# EasyEDA Pro project 辅助电源.epro, schematic 平面变压器_氮化镓电源
Board Name: 平面变压器_氮化镓电源; Create Date: 2025-12-22; Page Name: Sheet_1; Project Name: 辅助电源; Schematic Name: 平面变压器_氮化镓电源; Update Date: 2025-12-25; Add into BOM: yes; Company: Your Company; Convert to PCB: yes; Date: 2023-12-31; Draw By: adminismk; REV: 1.0; Sheet: 1/1; spicePre: .
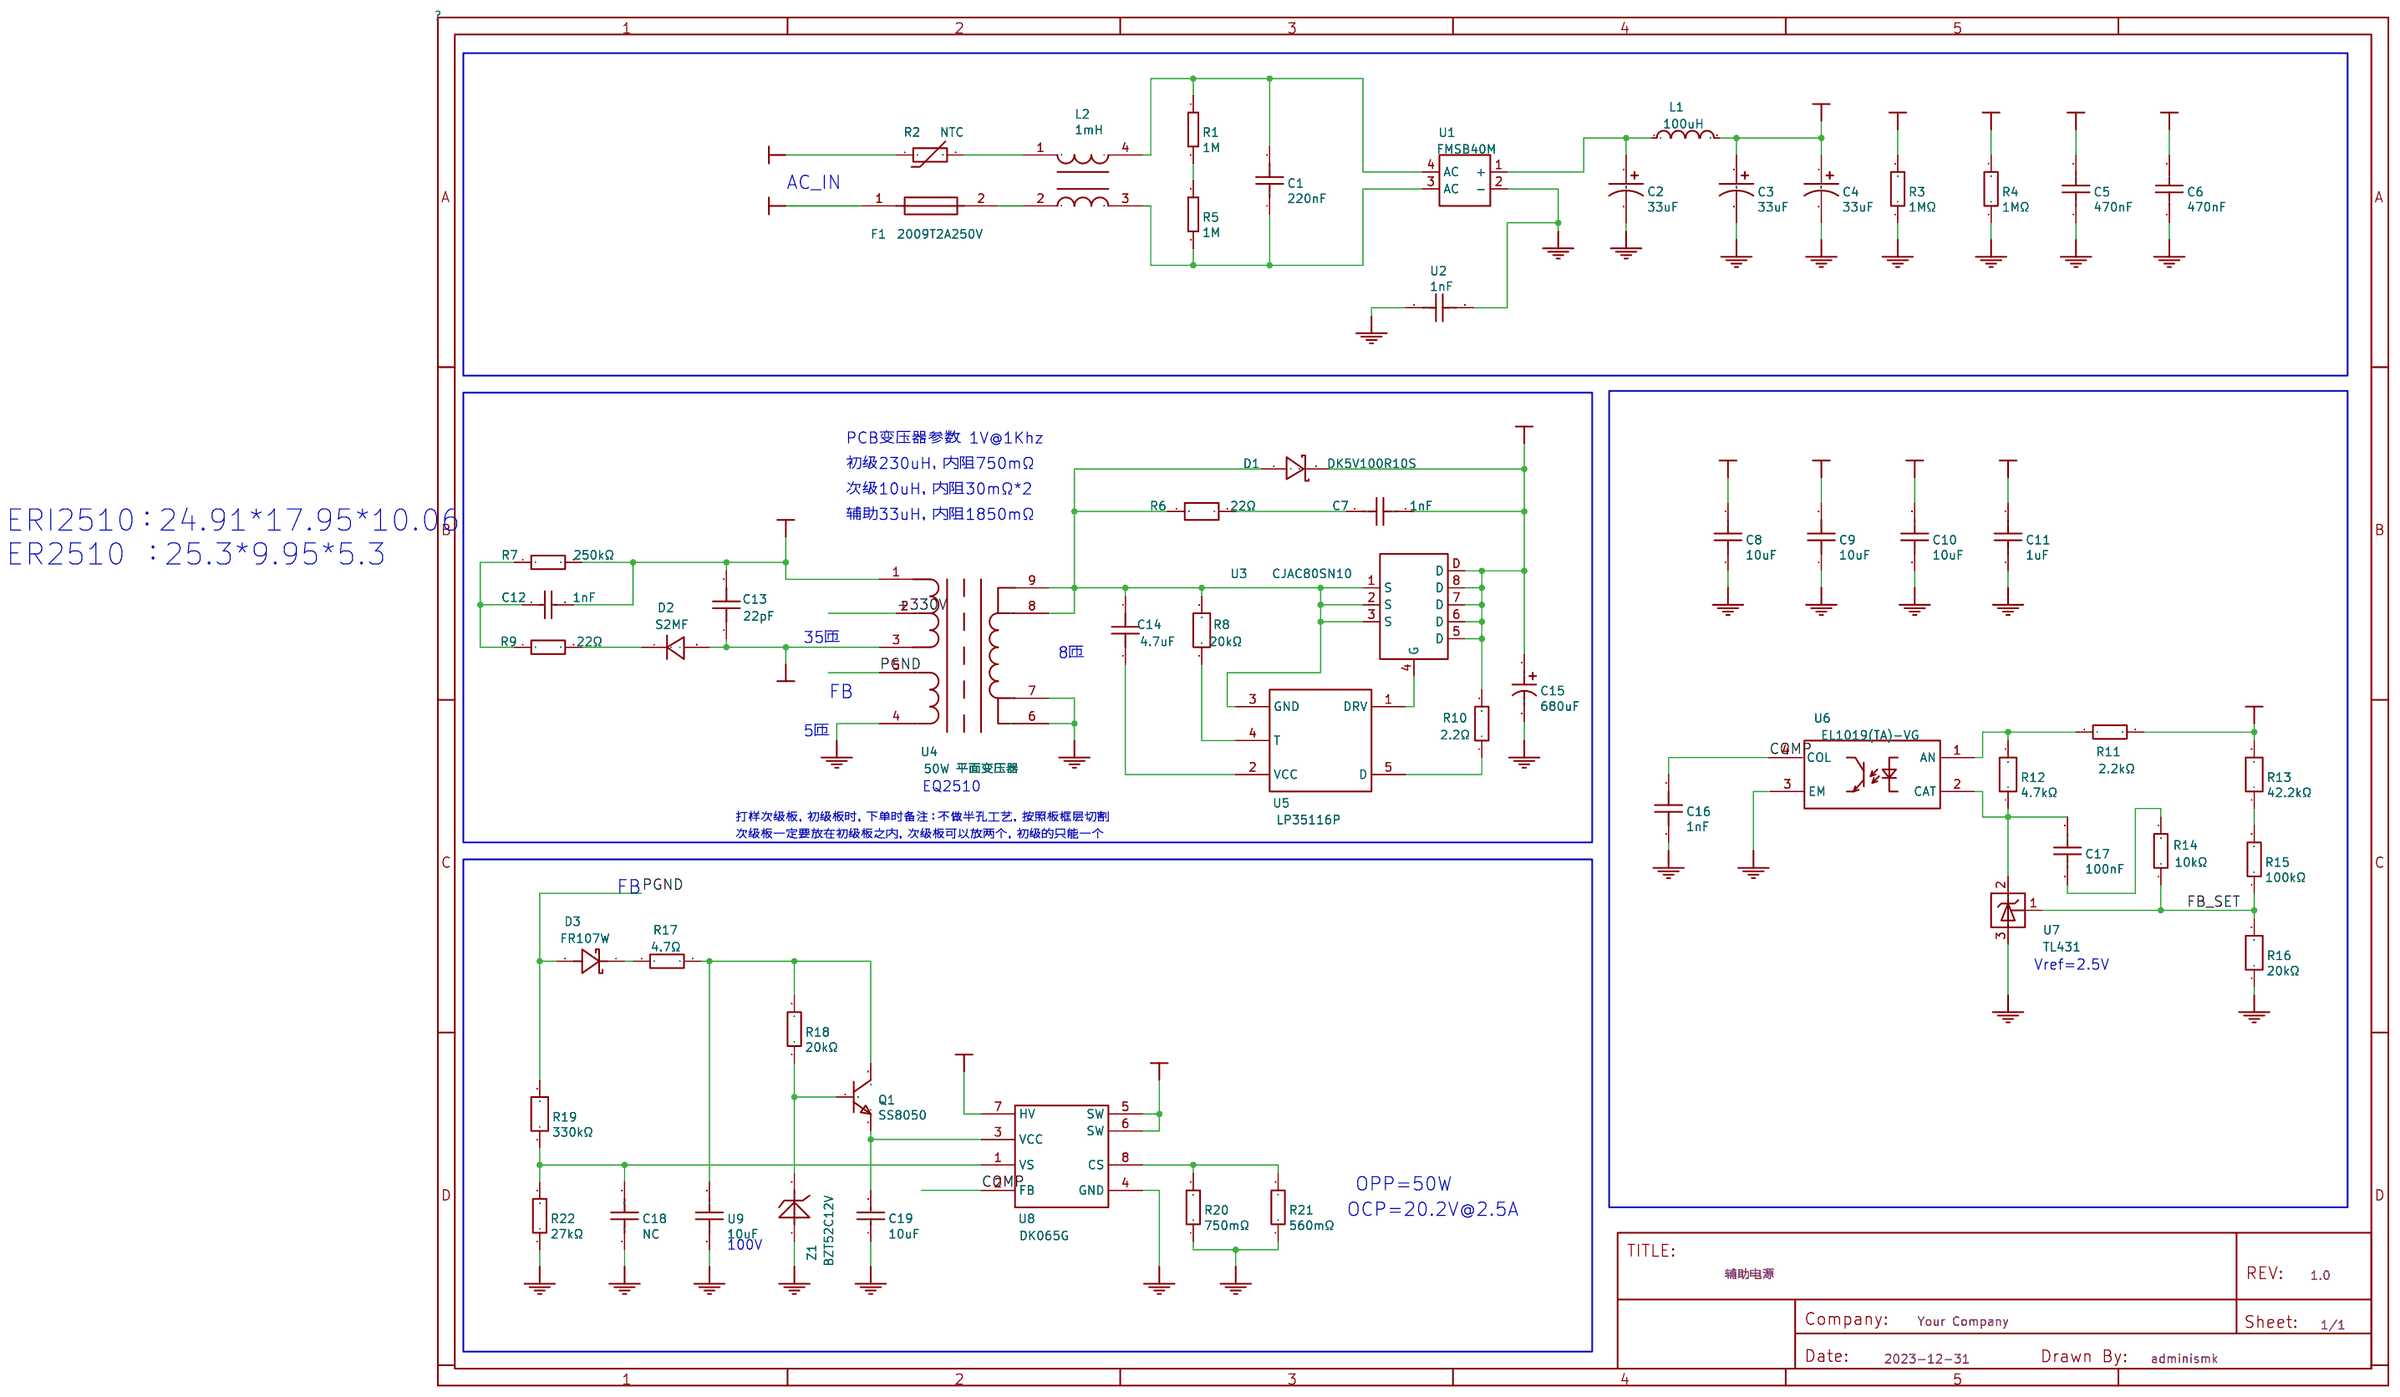
[diagram p1: schematic sheet]

## Parts
C1  220nF  [CAP-TH_L13.0-W6.0-P10.00-D0.6]  (no BOM)
C2  33uF  [CAP-TH_BD10.0-P5.00-D1.0-FD]  (no BOM)
C3  33uF  [CAP-TH_BD10.0-P5.00-D1.0-FD]  (no BOM)
C4  33uF  [CAP-TH_BD10.0-P5.00-D1.0-FD-H18.8]
C5  470nF  [C1210]
C6  470nF  [C1210]
C7  1nF  [R0603]
C8  10uF  [C1206]
C9  10uF  [C1206]
C10  10uF  [C1206]
C11  1uF  [R0603]
C12  1nF  [R1206]
C13  22pF  [R1206]
C14  4.7uF  [R0603]
C15  680uF  [CAP-TH_BD6.3-P2.50-D1.0]
C16  1nF  [R0603]
C17  100nF  [R0603]
C18  NC  [R0603]
C19  10uF  [R0603]
D1  DK5V100R10S  [SM-7_L5.6-W4.1_DK5V100R10S]
D2  S2MF  [SMAF_L3.5-W2.6-LS4.7-RD]
D3  FR107W  [SOD-123FL_L2.8-W1.8-LS3.6-RD]
F1  2009T2A250V  [FUSE-TH_L8.5-W4.0-P5.08-D0.6]  (no BOM)
L1  100uH  (no BOM)
L2  1mH  (no BOM)
Q1  SS8050  [SOT-23_L2.9-W1.3-P1.90-LS2.4-BR]
R1  1M  [R1206]  (no BOM)
R2  NTC  (no BOM)
R3  1MΩ  [R1206]
R4  1MΩ  [R1206]
R5  1M  [R1206]  (no BOM)
R6  22Ω  [R1206]
R7  250kΩ  [R1206]
R8  20kΩ  [R0603]
R9  22Ω  [R1206]
R10  2.2Ω  [R0603]
R11  2.2kΩ  [R0603]
R12  4.7kΩ  [R0603]
R13  42.2kΩ  [R0603]
R14  10kΩ  [R0603]
R15  100kΩ  [R0603]
R16  20kΩ  [R0603]
R17  4.7Ω  [R1206]
R18  20kΩ  [R0603]
R19  330kΩ  [R1206]
R20  750mΩ  [R1206]
R21  560mΩ  [R1206]
R22  27kΩ  [R0603]
U1  FMSB40M  [DIO-BG-SMD_UMSB]  (no BOM)
U2  1nF  [CAP-SMD_L8.0-W6.0-LS11.4]
U3  CJAC80SN10  [PG-TDSON-8-L5.5-W5.2-P1.27-LS6.4-BL]
U4  50W 平面变压器
U5  LP35116P  [PG-SOT23-5_L2.9-W1.6-P0.95-LS2.8-BR]
U6  EL1019(TA)-VG  [SOP-4_L7.5-W3.8-P2.54-LS10.2-TL]
U7  TL431  [SOT-23-3_L2.9-W1.8-P1.90-LS2.4-BR]
U8  DK065G  [PQFN-8_L8.0-W8.0_DK065G]
U9  10uF  [R1206]
Z1  BZT52C12V  [SOD-323_L1.7-W1.3-LS2.5-FD]

## Library data of the parts
C1 = 220nF: Supplier: LCSC; Supplier Part: C504197; Manufacturer: KNSCHA(科尼盛); Manufacturer Part: MPX224K31C3KN15690; JLCPCB Part Class: Extended Part; nameAlias: Value; Contributor: LCSC; spicePre: C; spiceSymbolName: MPX224K31C3KN15690
C2-C4 = 33uF: Supplier: LCSC; Supplier Part: C516822; Manufacturer: KNSCHA(科尼盛); Manufacturer Part: 87EC0179; JLCPCB Part Class: Extended Part; nameAlias: Value; Contributor: LCSC; spicePre: C; spiceSymbolName: 87EC0179
C5 C6 = 470nF: Supplier: LCSC; Supplier Part: C192761; Manufacturer: PSA(信昌电陶); Manufacturer Part: FM32X474K251EGG; JLCPCB Part Class: Extended Part; nameAlias: Value; Contributor: LCSC; spicePre: C; spiceSymbolName: FM32X474K251EGG
C7 = 1nF: Supplier: LCSC; Supplier Part: C376788; Manufacturer: YAGEO(国巨); Manufacturer Part: CC0603FRNPO9BN102; JLCPCB Part Class: Extended Part; nameAlias: Value; Contributor: LCSC; spicePre: C; spiceSymbolName: TCC0603COG471J500CT
C8-C10 U9 = 10uF: Supplier: LCSC; Supplier Part: C2167802; Manufacturer: Kyocera AVX; Manufacturer Part: 1206YC106KAT2A; Contributor: lcsc; nameAlias: Value; spicePre: U; spiceSymbolName: 1206YC106KAT2A
C11 = 1uF: Supplier: LCSC; Supplier Part: C5360778; Manufacturer: CCTC(三环); Manufacturer Part: TCC0603X7R105M250CT; Contributor: lcsc; nameAlias: Value; spicePre: U; spiceSymbolName: TCC0603X7R105M250CT
C12 = 1nF: Supplier: LCSC; Manufacturer: FH(风华); Manufacturer Part: 1206B102K202NT; Supplier Part: C9196; JLCPCB Part Class: Basic Part; nameAlias: Value; spicePre: C; spiceSymbolName: 1206B102K202NT
C13 = 22pF: Supplier: LCSC; Supplier Part: C577126; Manufacturer: YAGEO(国巨); Manufacturer Part: CC1206JKNPODBN220; JLCPCB Part Class: Extended Part; nameAlias: Value; Contributor: LCSC; spicePre: C; spiceSymbolName: CC1206JRNPO9BN220; Package Display: No
C14 = 4.7uF: Supplier: LCSC; Supplier Part: C277476; Manufacturer: YAGEO(国巨); Manufacturer Part: CC0603KRX5R7BB475; JLCPCB Part Class: Extended Part; nameAlias: Value; Contributor: LCSC; spicePre: C; spiceSymbolName: CC0603KRX5R7BB475
C15 = 680uF: Supplier: LCSC; Supplier Part: C697707; Manufacturer: Yunxing(云星); Manufacturer Part: SPT1EM681E16OR; JLCPCB Part Class: Extended Part; nameAlias: Value; Contributor: LCSC; spicePre: C; spiceSymbolName: SPT1EM681E16OR
C16 = 1nF: Supplier: LCSC; Supplier Part: C519402; Manufacturer: YAGEO(国巨); Manufacturer Part: CC0603KRX7R6BB102; Contributor: lcsc; nameAlias: Value; spicePre: U; spiceSymbolName: TCC0603X7R105M250CT
C17 = 100nF: Supplier: LCSC; Supplier Part: C91183; Manufacturer: YAGEO(国巨); Manufacturer Part: CC0603JRX7R9BB104; Contributor: lcsc; nameAlias: Value; spicePre: U; spiceSymbolName: TCC0603X7R105M250CT
C18 = NC: JLCPCB Part Class: Extended Part; nameAlias: Value; Contributor: LCSC; spicePre: C; spiceSymbolName: 0603N470J101
C19 = 10uF: Supplier: LCSC; Manufacturer: YAGEO(国巨); Manufacturer Part: CC0603MRX5R7BB106; Supplier Part: C109457; JLCPCB Part Class: Extended Part; nameAlias: Value; spicePre: C; spiceSymbolName: CC0603MRX5R7BB106
D1 = DK5V100R10S: Manufacturer: 东科半导体; Supplier Part: 淘宝诚意芯科技; Contributor: 13559232993; spicePre: D
D2 = S2MF: Supplier: LCSC; Manufacturer: 晶导微电子; Supplier Part: C108831; JLCPCB Part Class: Extended Part; spicePre: D; spiceSymbolName: S2MF_C108831
D3 = FR107W: Supplier: LCSC; Supplier Part: C18199114; Manufacturer: 宏迦橙; Contributor: lcsc; spicePre: D; spiceSymbolName: FR107W_C18199114
F1 = 2009T2A250V: Supplier: LCSC; Supplier Part: C529788; Manufacturer: Hongda(泓达); JLCPCB Part Class: Extended Part; Contributor: LCSC; spicePre: F
L1 = 100uH: Supplier: LCSC; Manufacturer: cjiang(长江微电); Manufacturer Part: FNR201610SR33MT; Supplier Part: C167667; JLCPCB Part Class: Extended Part; nameAlias: Value; Contributor: LCSC; spicePre: L; spiceSymbolName: FNR201610SR33MT
L2 = 1mH: Supplier: LCSC; JLCPCB Part Class: Extended Part; spicePre: L; spiceSymbolName: ZJYS51R5-2PT-01
Q1 = SS8050_C431710: 晶体管类型:NPN;集电极电流(Ic):1.5A;集射极击穿电压(Vceo):25V;功率(Pd):300mW;直流电流增益(hFE@Ic,Vce):120@100mA,1V;; LCSC Part Name: NPN 电流:1.5A 耐压:25V (200-350); Supplier Part: C431710; Manufacturer: MDD(辰达半导体); Supplier Footprint: SOT-23; JLCPCB Part Class: 扩展库; Datasheet: https://atta.szlcsc.com/upload/public/pdf/source/20240710/2275D45831FEB988B7478BE0F5F4041C.pdf; Supplier: LCSC; Transistor Type: NPN; Collector Current (Ic): 1.5A; Collector-Emitter Breakdown Voltage (Vceo): 25V; Power Dissipation (Pd): 300mW; DC Current Gain (hFE@Ic,Vce): 120@100mA,1V; Transition Frequency (fT): 100MHz; Collector Cut-Off Current (Icbo): 100nA; Collector-Emitter Saturation Voltage (VCE(sat)@Ic,Ib): 500mV@800mA,80mA; Operating Temperature: -55℃~+150℃
R1 R5 = 1M: Contributor: MoonLight__Shadow; spicePre: R
R2 = NTC: nameAlias: Value; spicePre: R; spiceSymbolName: NTC 10D-9
R3 R4 = 1MΩ: Supplier: LCSC; Supplier Part: C175518; Manufacturer: EVER OHMS(天二科技); Manufacturer Part: HR1206J1M00P05Z; JLCPCB Part Class: Extended Part; Contributor: LCSC; nameAlias: Value; spicePre: U; spiceSymbolName: HR1206J1MP05
R6 = 22Ω: Supplier: LCSC; Supplier Part: C881297; Manufacturer: EVER OHMS(天二科技); Manufacturer Part: CR1206J22R0P05Z; JLCPCB Part Class: Extended Part; Contributor: LCSC; nameAlias: Value; spicePre: R; spiceSymbolName: CR1206J22R0P05Z
R7 = 250kΩ: JLCPCB Part Class: Extended Part; nameAlias: Value; spicePre: R; spiceSymbolName: 1206W4F5103T5E
R8 = 20kΩ: Supplier: LCSC; Supplier Part: C2097022; Manufacturer: YAGEO(国巨); Manufacturer Part: AF0603JR-0720KL; JLCPCB Part Class: Extended Part; nameAlias: Value; Contributor: lcsc; spicePre: R; spiceSymbolName: AC0603JR-1310KL
R9 = 22Ω: Supplier: LCSC; Supplier Part: C176245; Manufacturer: EVER OHMS(天二科技); Manufacturer Part: QR1206J22R0P05Z; JLCPCB Part Class: Extended Part; nameAlias: Value; Contributor: LCSC; spicePre: R; spiceSymbolName: QR1206J22RP05
R10 = 2.2Ω: Supplier: LCSC; Manufacturer: YAGEO(国巨); Manufacturer Part: RT0603FRD072R2L; Supplier Part: C136937; JLCPCB Part Class: Extended Part; nameAlias: Value; Contributor: LCSC; spicePre: R; spiceSymbolName: RT0603FRD072R2L
R11 = 2.2kΩ: Supplier: LCSC; Supplier Part: C325591; Manufacturer: Tyohm(幸亚电阻); Manufacturer Part: RMC06032.2K1%N; JLCPCB Part Class: Extended Part; nameAlias: Value; Contributor: LCSC; spicePre: R; spiceSymbolName: RMC06032.2K1%N
R12 = 4.7kΩ: Supplier: LCSC; Supplier Part: C2904521; Manufacturer: Milliohm(毫欧); Manufacturer Part: HoLTT0603-1/10W-4.7K-1%; JLCPCB Part Class: Extended Part; nameAlias: Value; Contributor: LCSC; spicePre: R; spiceSymbolName: HOLTT0603-1/10W-4.7K-1%
R13 = 42.2kΩ: Supplier: LCSC; Supplier Part: C273741; Manufacturer: YAGEO(国巨); Manufacturer Part: RC0603FR-0742K2L; JLCPCB Part Class: Extended Part; Contributor: lcsc; nameAlias: Value; spicePre: R; spiceSymbolName: RC0603JR-130RL
R14 = 10kΩ: Supplier: LCSC; Manufacturer: YAGEO(国巨); Manufacturer Part: RT0603FRE0710KL; Supplier Part: C14675; JLCPCB Part Class: Basic Part; nameAlias: Value; spicePre: R; spiceSymbolName: 0603WAF2201T5E
R15 = 100kΩ: Supplier: LCSC; Supplier Part: C328419; Manufacturer: RESI(开步睿思）; Manufacturer Part: PTFR0603B100KP9; JLCPCB Part Class: Extended Part; nameAlias: Value; Contributor: LCSC; spicePre: R; spiceSymbolName: PTFR0603B100KP9
R16 = 20kΩ: Supplier: LCSC; Supplier Part: C105575; Manufacturer: YAGEO(国巨); Manufacturer Part: RC0603FR-0720KL; JLCPCB Part Class: Extended Part; nameAlias: Value; Contributor: LCSC; spicePre: R; spiceSymbolName: AC0603DR-0724KL
R17 = 4.7Ω: Supplier: LCSC; Supplier Part: C352063; Manufacturer: RESI(开步睿思）; Manufacturer Part: AECR1206F4R70T9; JLCPCB Part Class: Extended Part; nameAlias: Value; Contributor: LCSC; spicePre: R; spiceSymbolName: AECR1206F4R70T9
R18 = 20kΩ: Supplier: LCSC; Manufacturer: YAGEO(国巨); Manufacturer Part: RC0603DR-0720KL; Supplier Part: C137817; JLCPCB Part Class: Basic Part; nameAlias: Value; spicePre: R; spiceSymbolName: 0603WAF4701T5E
R19 = 330kΩ: Supplier: LCSC; Supplier Part: C706451; Manufacturer: YAGEO(国巨); Manufacturer Part: RT1206FRE07330KL; JLCPCB Part Class: Extended Part; Contributor: LCSC; nameAlias: Value; spicePre: R; spiceSymbolName: RV1206FR-07470KL
R20 = 750mΩ: Supplier: LCSC; Manufacturer: UNI-ROYAL(厚声); Manufacturer Part: 1206W4F750LT5E; Supplier Part: C19107; JLCPCB Part Class: Extended Part; nameAlias: Value; spicePre: R; spiceSymbolName: 1206W4F430LT5E
R21 = 560mΩ: Supplier: LCSC; Manufacturer: UNI-ROYAL(厚声); Manufacturer Part: 1206W4J056KT5E; Supplier Part: C247431; JLCPCB Part Class: Extended Part; nameAlias: Value; spicePre: R; spiceSymbolName: 1206W4F430LT5E
R22 = 27kΩ: Supplier: LCSC; Supplier Part: C352339; Manufacturer: RESI(开步睿思）; Manufacturer Part: AECR0603F27K0K9; JLCPCB Part Class: Extended Part; nameAlias: Value; Contributor: LCSC; spicePre: R; spiceSymbolName: AECR0603F27K0K9
U1 = FMSB40M: Supplier: LCSC; Supplier Part: C2985005; Manufacturer: GOODWORK(固得沃克); Contributor: lcsc; spicePre: U; spiceSymbolName: FMSB40M_C2985005
U2 = 1nF: Supplier: LCSC; Supplier Part: C20625790; Manufacturer: STE(松田); Manufacturer Part: SMDY13225Y5U102M0; JLCPCB Part Class: Extended Part; nameAlias: Value; Contributor: lcsc; spicePre: U; spiceSymbolName: SMDY13225Y5U102M0
U3 = CJAC80SN10: Manufacturer: 淘宝深圳市优信电子; Contributor: adminismk; spicePre: U; spiceSymbolName: CMSA012N10A
U4 = 50W 平面变压器: Contributor: adminismk; spicePre: U; spiceSymbolName: 65W 平面变压器
U5 = LP35116P: Contributor: adminismk; spicePre: U
U6 = EL1019(TA)-VG: Supplier: LCSC; Manufacturer: EVERLIGHT(亿光); Supplier Part: C79883; JLCPCB Part Class: Extended Part; Contributor: adminismk; spicePre: U
U7 = TL431: Supplier: LCSC; Supplier Part: C2874164; Manufacturer: GOFORD(谷峰); Manufacturer Part: TL431-1%; JLCPCB Part Class: Extended Part; Contributor: LCSC; spicePre: U; spiceSymbolName: TL431-1%
U8 = DK065G: Supplier: LCSC; Supplier Part: C9900013249; Manufacturer: null; Manufacturer Part: DK065GPQFN8*8; JLCPCB Part Class: Extended Part; Contributor: adminismk; spicePre: U; spiceSymbolName: DK065GPQFN8*8
Z1 = BZT52C12V: Manufacturer Part: BZT52C12VS; Supplier Part: 淘宝允易达旗舰店; Contributor: retardnow; spicePre: Z; spiceSymbolName: BZT52C12VS

## Nets
+20V: C7.1 C8.2 C9.2 C10.2 C11.1 C15.1 D1.2(K) R10.2 R11.2 R13.2 U3.5(D) U3.6(D) U3.7(D) U3.8(D) U3.D
+330V: C3.1 C4.1 C5.2 C6.2 C12.2 C13.2 L1.2 R3.2 R4.2 R7.2 U4.1 U4.2 U8.7(HV)
GND: C8.1 C9.1 C10.1 C11.2 C15.2 R16.1 U2.1 U4.6 U4.7 U7.3(A)
PGND: C2.2 C3.2 C4.2 C5.1 C6.1 C16.2 C18.1 C19.1 D3.2(A) R3.1 R4.1 R19.2 R20.1 R21.1 R22.1 U1.2(-) U2.2 U4.4 U4.5 U6.3(EM) U8.4(GND) U9.1 Z1.1(A)
+SW: C13.1 D2.2(A) U4.3 U8.5(SW) U8.6(SW)
COMP: C16.1 U6.4(COL) U8.2(FB)
FB_SET: R14.1 R15.1 R16.2 U7.1(R)
L: R2.1
N: F1.1
C7_2: C7.2 R6.2
C17_1: C17.1 R12.1 U6.2(CAT) U7.2(K)
Net-(C1-1): C1.1 L2.3 R5.2 U1.3(AC)
Net-(C1-2): C1.2 L2.4 R1.1 U1.4(AC)
Net-(C2-1): C2.1 L1.1 U1.1(+)
Net-(F1-2): F1.2 L2.2
Net-(L2-1): L2.1 R2.2
Net-(R1-2): R1.2 R5.1
Q1_1: Q1.1(B) R18.1 Z1.2(K)
Q1_3: Q1.3(C) R17.2 R18.2 U9.2
R9_1: C12.1 R7.1 R9.1
R9_2: D2.1(K) R9.2
R14_2: C17.2 R14.2
R15_2: R13.1 R15.2
R17_1: D3.1(K) R17.1
U3_4: U3.4(G) U5.1(DRV)
U4_8: C14.1 D1.1(A) R6.1 R8.2 U3.1(S) U3.2(S) U3.3(S) U4.8 U4.9 U5.3(GND)
U5_2: C14.2 U5.2(VCC)
U5_4: R8.1 U5.4(T)
U5_5: R10.1 U5.5(D)
U6_1: R11.1 R12.2 U6.1(AN)
U8_1: C18.2 R19.1 R22.2 U8.1(VS)
U8_3: C19.2 Q1.2(E) U8.3(VCC)
U8_8: R20.2 R21.2 U8.8(CS)

## Notes on the sheet
- AC_IN
- PCB变压器参数 1V@1Khz
- 初级230uH，内阻750mΩ
- ERI2510：24.91*17.95*10.06
  ER2510 ：25.3*9.95*5.3
- 次级10uH，内阻30mΩ*2
- 辅助33uH，内阻1850mΩ
- 35匝
- 8匝
- FB
- 5匝
- EQ2510
- 打样次级板，初级板时，下单时备注：不做半孔工艺，按照板框层切割
- 次级板一定要放在初级板之内，次级板可以放两个，初级的只能一个
- FB
- Vref=2.5V
- OPP=50W
- OCP=20.2V@2.5A
- 100V
